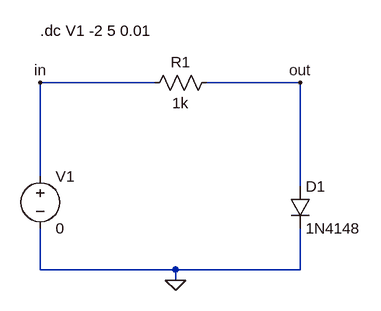
[diagram p0: schematic W02_D01_Diode_IV.asc]
W02_D01_Diode_IV.asc, the LTspice schematic file:
Version 4.1
SHEET 1 880 680
WIRE 224 -48 48 -48
WIRE 448 -48 304 -48
WIRE 48 96 48 -48
WIRE 448 112 448 -48
WIRE 48 240 48 176
WIRE 256 240 48 240
WIRE 448 240 448 176
WIRE 448 240 256 240
WIRE 256 256 256 240
FLAG 256 256 0
FLAG 48 -48 in
FLAG 448 -48 out
SYMBOL voltage 48 80 R0
WINDOW 123 0 0 Left 0
WINDOW 39 0 0 Left 0
SYMATTR InstName V1
SYMATTR Value 0
SYMBOL res 320 -64 R90
WINDOW 0 0 56 VBottom 2
WINDOW 3 32 56 VTop 2
SYMATTR InstName R1
SYMATTR Value 1k
SYMBOL diode 432 112 R0
SYMATTR InstName D1
SYMATTR Value 1N4148
TEXT 48 -128 Left 2 !.dc V1 -2 5 0.01

The netlist it stands for:
* W02_D01_Diode_IV.asc
V1 in 0 0
R1 out in 1k
D1 out 0 1N4148
.model D D
.lib standard.dio
.dc V1 -2 5 0.01
.backanno
.end